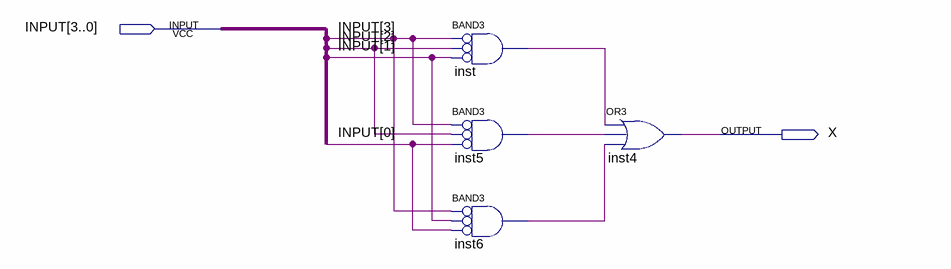
[diagram p0: schematic sheet]
// Quartus schematic projectHJLEE.bdf as structural Verilog: 4 symbols, 2 pins
module projectHJLEE (
  input  [3:0] INPUT,
  output X
);

  wire inst5_out, inst6_out, inst_out;

  and inst (inst_out, ~INPUT[3], ~INPUT[2], ~INPUT[1]);  // BAND3
  and inst5 (inst5_out, ~INPUT[3], ~INPUT[2], ~INPUT[0]);  // BAND3
  and inst6 (inst6_out, ~INPUT[3], ~INPUT[1], ~INPUT[0]);  // BAND3
  or inst4 (X, inst_out, inst5_out, inst6_out);
endmodule
